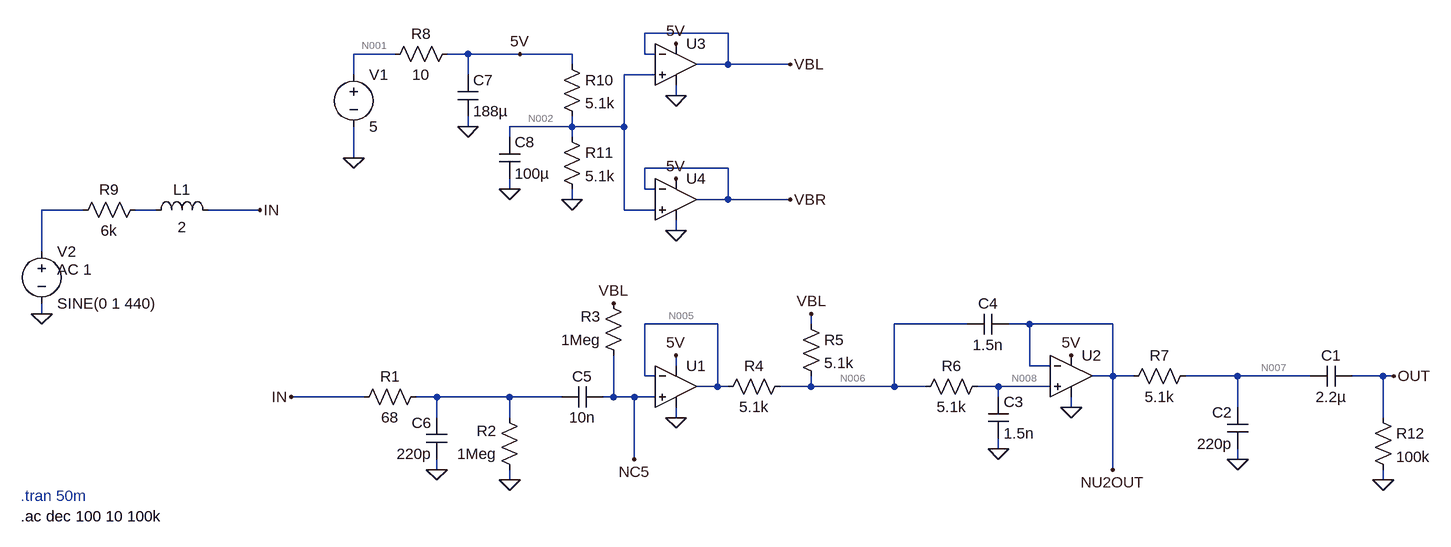
[diagram p0: schematic Analog.asc]
Analog.asc, the LTspice schematic file:
Version 4.1
SHEET 1 1636 680
WIRE 544 -480 416 -480
WIRE 32 -448 -32 -448
WIRE 144 -448 112 -448
WIRE 224 -448 144 -448
WIRE 304 -448 224 -448
WIRE 416 -448 416 -480
WIRE 432 -448 416 -448
WIRE 304 -432 304 -448
WIRE 544 -432 544 -480
WIRE 544 -432 496 -432
WIRE 640 -432 544 -432
WIRE -32 -416 -32 -448
WIRE 144 -416 144 -448
WIRE 432 -416 384 -416
WIRE 464 -384 464 -400
WIRE 144 -336 144 -352
WIRE 304 -336 304 -352
WIRE 304 -336 208 -336
WIRE 384 -336 384 -416
WIRE 384 -336 304 -336
WIRE 208 -320 208 -336
WIRE 304 -320 304 -336
WIRE -32 -288 -32 -336
WIRE 544 -272 416 -272
WIRE 208 -240 208 -256
WIRE 416 -240 416 -272
WIRE 432 -240 416 -240
WIRE 304 -224 304 -240
WIRE 544 -224 544 -272
WIRE 544 -224 496 -224
WIRE 640 -224 544 -224
WIRE -448 -208 -512 -208
WIRE -336 -208 -368 -208
WIRE -176 -208 -256 -208
WIRE 384 -208 384 -336
WIRE 432 -208 384 -208
WIRE 464 -176 464 -192
WIRE -512 -144 -512 -208
WIRE -512 -48 -512 -64
WIRE 528 -32 416 -32
WIRE 672 -32 672 -48
WIRE 912 -32 800 -32
WIRE 1008 -32 976 -32
WIRE 1136 -32 1008 -32
WIRE 464 32 464 16
WIRE 1008 32 1008 -32
WIRE 1040 32 1008 32
WIRE 416 48 416 -32
WIRE 432 48 416 48
WIRE 1136 48 1136 -32
WIRE 1136 48 1104 48
WIRE 1168 48 1136 48
WIRE 1328 48 1248 48
WIRE 1440 48 1328 48
WIRE 1552 48 1504 48
WIRE 1568 48 1552 48
WIRE 528 64 528 -32
WIRE 528 64 496 64
WIRE 544 64 528 64
WIRE 672 64 672 48
WIRE 672 64 624 64
WIRE 800 64 800 -32
WIRE 800 64 672 64
WIRE 848 64 800 64
WIRE 960 64 928 64
WIRE 1040 64 960 64
WIRE -16 80 -128 80
WIRE 96 80 64 80
WIRE 208 80 96 80
WIRE 288 80 208 80
WIRE 368 80 368 16
WIRE 368 80 352 80
WIRE 400 80 368 80
WIRE 432 80 400 80
WIRE 960 80 960 64
WIRE 1072 96 1072 80
WIRE 1328 96 1328 48
WIRE 96 112 96 80
WIRE 208 112 208 80
WIRE 464 112 464 96
WIRE 1552 112 1552 48
WIRE 960 160 960 144
WIRE 400 176 400 80
WIRE 1328 176 1328 160
WIRE 96 192 96 176
WIRE 1136 192 1136 48
WIRE 208 208 208 192
WIRE 1552 208 1552 192
FLAG 96 192 0
FLAG 208 208 0
FLAG 960 160 0
FLAG 1328 176 0
FLAG -32 -288 0
FLAG 144 -336 0
FLAG 464 -384 0
FLAG 464 -176 0
FLAG 224 -448 5V
FLAG 464 -464 5V
FLAG 464 -256 5V
FLAG 464 16 5V
FLAG 1072 16 5V
FLAG 640 -432 VBL
FLAG 368 -64 VBL
FLAG 672 -48 VBL
FLAG 464 112 0
FLAG 1072 96 0
FLAG -512 -48 0
FLAG -176 -208 IN
FLAG -128 80 IN
FLAG 1568 48 OUT
FLAG 640 -224 VBR
FLAG 304 -224 0
FLAG 208 -240 0
FLAG 400 176 NC5
FLAG 1136 192 NU2OUT
FLAG 1552 208 0
SYMBOL res 80 64 R90
WINDOW 0 0 56 VBottom 2
WINDOW 3 32 56 VTop 2
SYMATTR InstName R1
SYMATTR Value 68
SYMBOL res 224 208 R180
WINDOW 0 36 76 Left 2
WINDOW 3 36 40 Left 2
SYMATTR InstName R2
SYMATTR Value 1Meg
SYMBOL res 384 32 R180
WINDOW 0 36 76 Left 2
WINDOW 3 36 40 Left 2
SYMATTR InstName R3
SYMATTR Value 1Meg
SYMBOL res 640 48 R90
WINDOW 0 0 56 VBottom 2
WINDOW 3 32 56 VTop 2
SYMATTR InstName R4
SYMATTR Value 5.1k
SYMBOL res 656 -48 R0
SYMATTR InstName R5
SYMATTR Value 5.1k
SYMBOL res 944 48 R90
WINDOW 0 0 56 VBottom 2
WINDOW 3 32 56 VTop 2
SYMATTR InstName R6
SYMATTR Value 5.1k
SYMBOL res 1264 32 R90
WINDOW 0 0 56 VBottom 2
WINDOW 3 32 56 VTop 2
SYMATTR InstName R7
SYMATTR Value 5.1k
SYMBOL cap 1504 32 R90
WINDOW 0 0 32 VBottom 2
WINDOW 3 32 32 VTop 2
SYMATTR InstName C1
SYMATTR Value 2.2µ
SYMBOL cap 1344 160 R180
WINDOW 0 24 56 Left 2
WINDOW 3 24 8 Left 2
SYMATTR InstName C2
SYMATTR Value 220p
SYMBOL cap 944 80 R0
SYMATTR InstName C3
SYMATTR Value 1.5n
SYMBOL cap 912 -16 R270
WINDOW 0 32 32 VTop 2
WINDOW 3 0 32 VBottom 2
SYMATTR InstName C4
SYMATTR Value 1.5n
SYMBOL cap 352 64 R90
WINDOW 0 0 32 VBottom 2
WINDOW 3 32 32 VTop 2
SYMATTR InstName C5
SYMATTR Value 10n
SYMBOL cap 112 176 R180
WINDOW 0 24 56 Left 2
WINDOW 3 24 8 Left 2
SYMATTR InstName C6
SYMATTR Value 220p
SYMBOL OpAmps\\UniversalOpAmp2 464 64 R0
SYMATTR InstName U1
SYMATTR Value2 Avol=100k GBW=1Meg Slew=0.6Meg
SYMATTR SpiceLine Ilimit=25m Rail=50m Vos=0.4m
SYMBOL OpAmps\\UniversalOpAmp2 1072 48 R0
SYMATTR InstName U2
SYMATTR Value2 Avol=100k GBW=1Meg Slew=0.6Meg
SYMATTR SpiceLine Ilimit=25m Rail=50m Vos=0.4m
SYMBOL OpAmps\\UniversalOpAmp2 464 -432 R0
SYMATTR InstName U3
SYMATTR Value2 Avol=100k GBW=1Meg Slew=0.6Meg
SYMATTR SpiceLine Ilimit=25m Rail=50m Vos=0.4m
SYMBOL OpAmps\\UniversalOpAmp2 464 -224 R0
SYMATTR InstName U4
SYMATTR Value2 Avol=100k GBW=1Meg Slew=0.6Meg
SYMATTR SpiceLine Ilimit=25m Rail=50m Vos=0.4m
SYMBOL voltage -32 -432 R0
SYMATTR InstName V1
SYMATTR Value 5
SYMBOL res 128 -464 R90
WINDOW 0 0 56 VBottom 2
WINDOW 3 32 56 VTop 2
SYMATTR InstName R8
SYMATTR Value 10
SYMBOL cap 128 -416 R0
SYMATTR InstName C7
SYMATTR Value 188µ
SYMBOL voltage -512 -160 R0
WINDOW 123 24 44 Left 2
WINDOW 39 0 0 Left 0
SYMATTR InstName V2
SYMATTR Value SINE(0 1 440)
SYMATTR Value2 AC 1
SYMBOL res -352 -224 R90
WINDOW 0 0 56 VBottom 2
WINDOW 3 32 56 VTop 2
SYMATTR InstName R9
SYMATTR Value 6k
SYMBOL res 288 -448 R0
SYMATTR InstName R10
SYMATTR Value 5.1k
SYMBOL res 288 -336 R0
SYMATTR InstName R11
SYMATTR Value 5.1k
SYMBOL cap 192 -320 R0
SYMATTR InstName C8
SYMATTR Value 100µ
SYMBOL ind -352 -192 R270
WINDOW 0 32 56 VTop 2
WINDOW 3 5 56 VBottom 2
SYMATTR InstName L1
SYMATTR Value 2
SYMATTR SpiceLine Rser=1m
SYMBOL res 1536 96 R0
SYMATTR InstName R12
SYMATTR Value 100k
TEXT -544 232 Left 2 ;.tran 50m
TEXT -544 264 Left 2 !.ac dec 100 10 100k

The netlist it stands for:
* Analog.asc
R1 N009 IN 68
R2 0 N009 1Meg
R3 NC5 VBL 1Meg
R4 N006 N005 5.1k
R5 VBL N006 5.1k
R6 N008 N006 5.1k
R7 N007 NU2OUT 5.1k
C1 OUT N007 2.2µ
C2 0 N007 220p
C3 N008 0 1.5n
C4 N006 NU2OUT 1.5n
C5 NC5 N009 10n
C6 0 N009 220p
X§U1 NC5 N005 5V 0 N005 level2 Avol=100k GBW=1Meg Slew=0.6Meg Ilimit=25m Rail=50m Vos=0.4m En=0 Enk=0 In=0 Ink=0 Rin=500Meg  ; pins In+ In- V+ V- OUT
X§U2 N008 NU2OUT 5V 0 NU2OUT level2 Avol=100k GBW=1Meg Slew=0.6Meg Ilimit=25m Rail=50m Vos=0.4m En=0 Enk=0 In=0 Ink=0 Rin=500Meg  ; pins In+ In- V+ V- OUT
X§U3 N002 VBL 5V 0 VBL level2 Avol=100k GBW=1Meg Slew=0.6Meg Ilimit=25m Rail=50m Vos=0.4m En=0 Enk=0 In=0 Ink=0 Rin=500Meg  ; pins In+ In- V+ V- OUT
X§U4 N002 VBR 5V 0 VBR level2 Avol=100k GBW=1Meg Slew=0.6Meg Ilimit=25m Rail=50m Vos=0.4m En=0 Enk=0 In=0 Ink=0 Rin=500Meg  ; pins In+ In- V+ V- OUT
V1 N001 0 5
R8 5V N001 10
C7 5V 0 188µ
V2 N003 0 SINE(0 1 440) AC 1
R9 N004 N003 6k
R10 5V N002 5.1k
R11 N002 0 5.1k
C8 N002 0 100µ
L1 N004 IN 2 Rser=1m
R12 OUT 0 100k
* .tran 50m
.ac dec 100 10 100k
.lib UniversalOpAmp2.lib
.backanno
.end

* Results of the author's LTspice run, read from the files saved beside the schematic
* Operating Point, zero values left out:
*   V(5v) = 4.985 V
*   V(n001) = 5 V
*   V(n002) = 2.493 V
*   V(n005) = 2.493 V
*   V(n006) = 2.493 V
*   V(n007) = 2.494 V
*   V(n008) = 2.493 V
*   V(nc5) = 2.493 V
*   V(nu2out) = 2.494 V
*   V(vbl) = 2.493 V
*   V(vbr) = 2.493 V
*   I(R10) = 488.8 µA
*   I(R11) = 488.8 µA
*   I(R4) = -39.14 nA
*   I(R5) = -39.14 nA
*   I(R6) = -1.199 pA
*   I(R8) = -1.465 mA
*   I(V1) = -1.465 mA
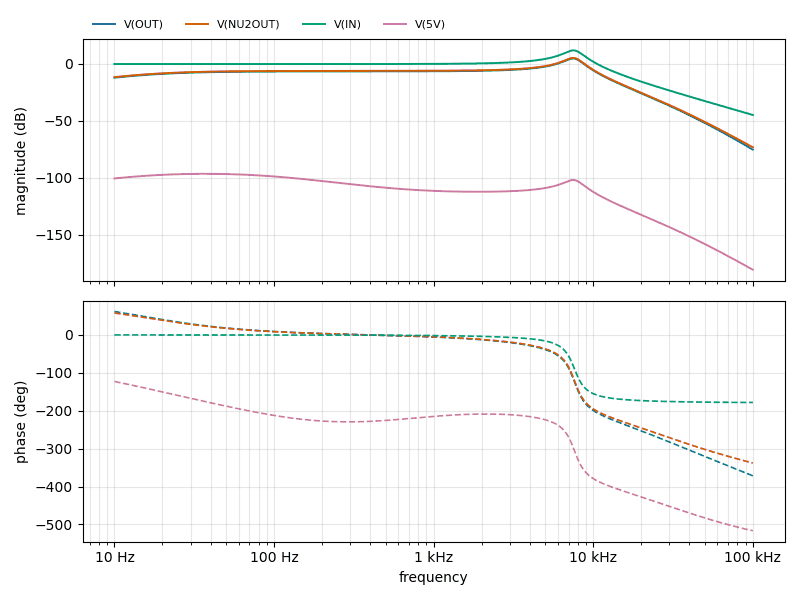
[diagram p1: AC Analysis of Analog.asc, plotted from the saved traces]
* AC Analysis, 1 run:
*   V(OUT): -12.03 dB at 10 Hz, -75.20 dB at 100 kHz, peak 4.75 dB at 7.413 kHz, 3 dB below the peak at 6.409 kHz and 8.399 kHz
*   V(NU2OUT): -11.58 dB at 10 Hz, -73.15 dB at 100 kHz, peak 5.19 dB at 7.413 kHz, 3 dB below the peak at 6.41 kHz and 8.4 kHz
*   V(IN): -0.07 dB at 10 Hz, -44.75 dB at 100 kHz, peak 11.88 dB at 7.586 kHz, 3 dB below the peak at 6.456 kHz and 8.431 kHz
*   V(5V): -100.44 dB at 10 Hz, -180.48 dB at 100 kHz, peak -96.38 dB at 37.15 Hz, 3 dB below the peak at 12 Hz and 115.1 Hz